# Altium schematic sheet 03_USBC_PD.SchDoc
size A3; SheetNumber: 4; SheetTotal: 6
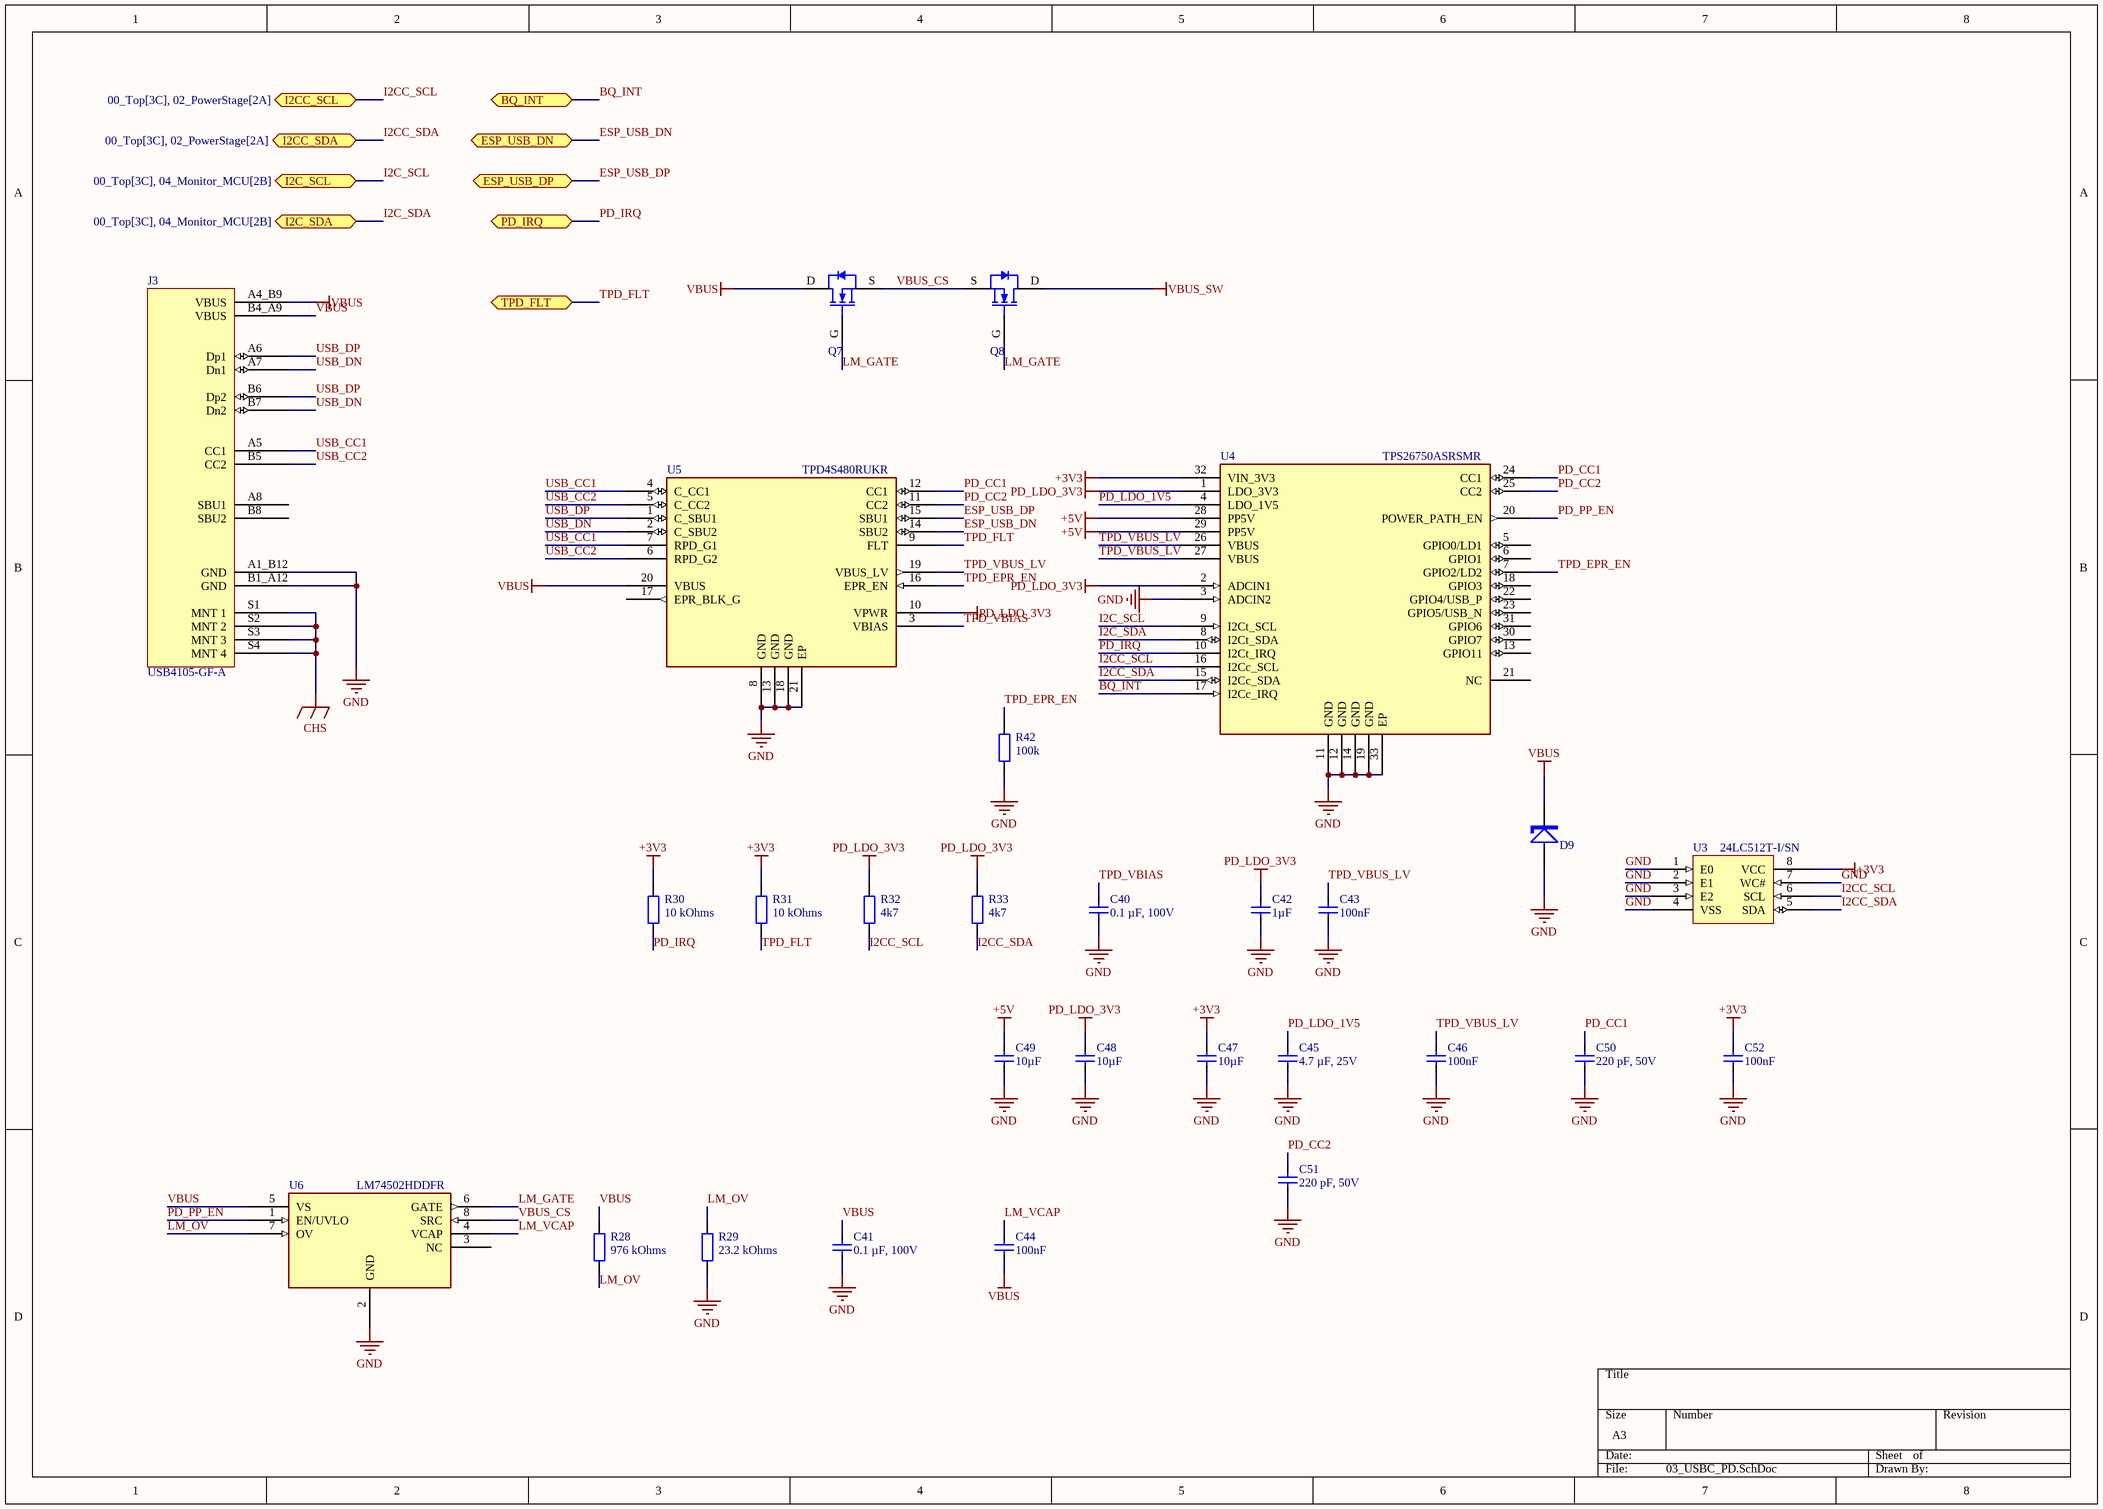
[diagram p0: 03_USBC_PD.SchDoc]

## Parts
C40  0.1 µF, 100V  [CAPC1608X10N]
C41  0.1 µF, 100V  [CAPC1608X10N]
C42  1µF  [CAPC1608X10N]
C43  100nF  [CAPC1608X10N]
C44  100nF  [CAPC1608X10N]
C45  4.7 µF, 25V  [CAPC2012X15N]
C46  100nF  [CAPC1608X10N]
C47  10µF  [CAPC2012X15N]
C48  10µF  [CAPC2012X15N]
C49  10µF  [CAPC2012X15N]
C50  220 pF, 50V  [CAPC1005X06N]
C51  220 pF, 50V  [CAPC1005X06N]
C52  100nF  [CAPC1005X06N]
D9  SMBJ54A  [SMB]  (value not drawn)
J3  USB4105-GF-A  [GCT_USB4105-GF-A]
Q7  BSZ097N10NS5ATMA1  [TRANS_PG-TSDSON-8]  (value not drawn)
Q8  BSZ097N10NS5ATMA1  [TRANS_PG-TSDSON-8]  (value not drawn)
R28  976 kOhms  [RESC1005X04N]
R29  23.2 kOhms  [RESC1005X04N]
R30  10 kOhms  [RESC1005X04N]
R31  10 kOhms  [RESC1005X04N]
R32  4k7  [RESC1005X04N]
R33  4k7  [RESC1005X04N]
R42  100k  [RESC1005X04N]
U3  24LC512T-I/SN  [SOIC127P600X175-8N]
U4  TPS26750ASRSMR  [TI-S-PVQFN-N32]
U5  TPD4S480RUKR  [QFN40P300X300X80-21N]
U6  LM74502HDDFR  [SOT65P280X100-8N]

## Ports
BQ_INT (bidir), ESP_USB_DN (bidir), ESP_USB_DP (bidir), I2C_SCL (bidir, see 00_Top[3C], 04_Monitor_MCU[2B]), I2C_SDA (bidir, see 00_Top[3C], 04_Monitor_MCU[2B]), I2CC_SCL (bidir, see 00_Top[3C], 02_PowerStage[2A]), I2CC_SDA (bidir, see 00_Top[3C], 02_PowerStage[2A]), PD_IRQ (bidir), TPD_FLT (bidir)

## Nets
+3V3: C47.2 C52.2 R30.2 R31.2 U3.8(VCC) U4.32(VIN_3V3)
+5V: C49.2 U4.28(PP5V) U4.29(PP5V)
CHS: J3.S1(MNT_1) J3.S2(MNT_2) J3.S3(MNT_3) J3.S4(MNT_4)
GND: C40.1 C41.1 C42.1 C43.1 C45.1 C46.1 C47.1 C48.1 C49.1 C50.1 C51.1 C52.1 D9.A J3.A1_B12(GND) J3.B1_A12(GND) R29.1 R42.1 U3.1(E0) U3.2(E1) U3.3(E2) U3.4(VSS) U3.7(WC#) U4.3(ADCIN2) U4.11(GND) U4.12(GND) U4.14(GND) U4.19(GND) U4.33(EP) U5.8(GND) U5.13(GND) U5.18(GND) U5.21(EP) U6.2(GND)
PD_LDO_3V3: C42.2 C48.2 R32.2 R33.2 U4.1(LDO_3V3) U4.2(ADCIN1) U5.10(VPWR)
VBUS: C41.2 C44.1 D9.K J3.A4_B9(VBUS) J3.B4_A9(VBUS) Q7.D(Drain) R28.2 U5.20(VBUS) U6.5(VS)
VBUS_SW: Q8.D(Drain)
BQ_INT: U4.17(I2Cc_IRQ) ; port BQ_INT
ESP_USB_DN: U5.14(SBU2) ; port ESP_USB_DN
ESP_USB_DP: U5.15(SBU1) ; port ESP_USB_DP
I2C_SCL: U4.9(I2Ct_SCL) ; port I2C_SCL
I2C_SDA: U4.8(I2Ct_SDA) ; port I2C_SDA
I2CC_SCL: R32.1 U3.6(SCL) U4.16(I2Cc_SCL) ; port I2CC_SCL
I2CC_SDA: R33.1 U3.5(SDA) U4.15(I2Cc_SDA) ; port I2CC_SDA
LM_GATE: Q7.G(Gate) Q8.G(Gate) U6.6(GATE)
LM_OV: R28.1 R29.2 U6.7(OV)
LM_VCAP: C44.2 U6.4(VCAP)
PD_CC1: C50.2 U4.24(CC1) U5.12(CC1)
PD_CC2: C51.2 U4.25(CC2) U5.11(CC2)
PD_IRQ: R30.1 U4.10(I2Ct_IRQ) ; port PD_IRQ
PD_LDO_1V5: C45.2 U4.4(LDO_1V5)
PD_PP_EN: U4.20(POWER_PATH_EN) U6.1(EN/UVLO)
TPD_EPR_EN: R42.2 U4.7(GPIO2/LD2) U5.16(EPR_EN)
TPD_FLT: R31.1 U5.9(FLT) ; port TPD_FLT
TPD_VBIAS: C40.2 U5.3(VBIAS)
TPD_VBUS_LV: C43.2 C46.2 U4.26(VBUS) U4.27(VBUS) U5.19(VBUS_LV)
USB_CC1: J3.A5(CC1) U5.4(C_CC1) U5.7(RPD_G1)
USB_CC2: J3.B5(CC2) U5.5(C_CC2) U5.6(RPD_G2)
USB_DN: J3.A7(Dn1) J3.B7(Dn2) U5.2(C_SBU2)
USB_DP: J3.A6(Dp1) J3.B6(Dp2) U5.1(C_SBU1)
VBUS_CS: Q7.S(Source) Q8.S(Source) U6.8(SRC)

Not connected (* = marked no-connect by the designer): J3 A8(SBU1) B8(SBU2); U4 5(GPIO0/LD1) 6(GPIO1) 13(GPIO11) 18(GPIO3) 21(NC) 22(GPIO4/USB_P) 23(GPIO5/USB_N) 30(GPIO7) 31(GPIO6); U5 17(EPR_BLK_G); U6 3(NC)

## Library data of the parts
C40 C41 = CGA3E3X7S2A104K080AB: CAP CER 0.1UF 100V X7S 0603; Manufacturer 1: TDK; AEC-Q200: True; Capacitance: 0.1 µF; Tolerance: ±10%; Case Code (Imperial): 0603; Manufacturer Part Number 1: CGA3E3X7S2A104K080AB; Mounting Type: Surface Mount, MLCC; Part Name: CGA3E3X7S2A104K080AB; Supplier 1: Digi-Key; Supplier Part Number 1: 445-6938-2-ND; Temperature Coefficient: X7S; Voltage Rating: 100V
C42 = CGA3E1X7R1C105M080AC: CAP CER 1UF 16V X7R 0603; Manufacturer 1: TDK Corporation; AEC-Q200: True; Tolerance: ±20%; Capacitance: 1 µF; Case Code (Imperial): 0603; Manufacturer Part Number 1: CGA3E1X7R1C105M080AC; Mounting Type: 0.063" L x 0.031" W (1.60mm x 0.80mm); Part Name: CGA3E1X7R1C105M080AC; Supplier 1: Digi-Key; Supplier Part Number 1: 445-12540-1-ND; Temperature Coefficient: X7R; Voltage Rating: 16V
C43 C44 C46 = CGA3E2X7R1H104M080AA: CAP CER 0.1UF 50V X7R 0603; Manufacturer 1: TDK Corporation; AEC-Q200: True; Capacitance: 0.1 µF; Tolerance: ±20%; Case Code (Imperial): 0603; Manufacturer Part Number 1: CGA3E2X7R1H104M080AA; Mounting Type: 0.063" L x 0.031" W (1.60mm x 0.80mm); Part Name: CGA3E2X7R1H104M080AA; Supplier 1: Digi-Key; Supplier Part Number 1: 445-12561-1-ND; Temperature Coefficient: X7R; Voltage Rating: 50V
C45 = CGA4J1X7R1E475K125AC: CAP CER 4.7UF 25V X7R 0805; Manufacturer 1: TDK; AEC-Q200: True; Capacitance: 4.7 µF; Tolerance: ±10%; Case Code (Imperial): 0805; Manufacturer Part Number 1: CGA4J1X7R1E475K125AC; Mounting Type: Surface Mount, MLCC; Part Name: CGA4J1X7R1E475K125AC; Supplier 1: Digi-Key; Supplier Part Number 1: 445-6967-2-ND; Temperature Coefficient: X7R; Voltage Rating: 25V
C47-C49 = CGA4J1X7S1C106K125AC: CAP CER 10UF 16V X7S 0805; Manufacturer 1: TDK Corporation; AEC-Q200: True; Tolerance: ±10%; Capacitance: 10 µF; Case Code (Imperial): 0805; Manufacturer Part Number 1: CGA4J1X7S1C106K125AC; Mounting Type: Surface Mount, MLCC; Part Name: CGA4J1X7S1C106K125AC; Supplier 1: Digi-Key; Supplier Part Number 1: 445-16110-1-ND; Temperature Coefficient: X7S; Voltage Rating: 16V
C50 C51 = CGA2B2C0G1H221J050BA: CAP CER 220PF 50V C0G/NP0 0402; Manufacturer 1: TDK Corporation; AEC-Q200: True; Temperature Coefficient: C0G, NP0; Tolerance: ±5%; Capacitance: 220 pF; Case Code (Imperial): 0402; Manufacturer Part Number 1: CGA2B2C0G1H221J050BA; Mounting Type: Surface Mount, MLCC; Part Name: CGA2B2C0G1H221J050BA; Supplier 1: Digi-Key; Voltage Rating: 50V
C52 = CGA2B1X7R1C104K050BC: CAP CER 0.1UF 16V X7R 0402; Manufacturer 1: TDK Corporation; AEC-Q200: True; Capacitance: 0.1 µF; Tolerance: ±10%; Case Code (Imperial): 0402; Manufacturer Part Number 1: CGA2B1X7R1C104K050BC; Mounting Type: Surface Mount, MLCC; Part Name: CGA2B1X7R1C104K050BC; Supplier 1: Digi-Key; Supplier Part Number 1: 445-5613-1-ND; Temperature Coefficient: X7R; Voltage Rating: 16V
D9 = SMBJ54A: TVS DIODE 54VWM 87.1VC DO214AA; Manufacturer 1: Littelfuse Inc.; Diode Type: Zener; Current Average: 6.9A; Voltage Reverse: 60V; AEC-Q200: False; Part Name: SMBJ54A; Supplier 1: Digi-Key; Supplier Part Number 1: SMBJ54ALFTR-ND; Manufacturer Part Number 1: SMBJ54A; Voltage Forward: -; Package / Case: DO-214AA, SMB; Supplier Device Package: DO-214AA (SMBJ)
J3 = USB4105-GF-A: CONN RCP USB2.0 TYP C 24P SMD RA; Manufacturer 1: GCT; Value: *; Availability: Unavailable; Price: None; Package: None; MP: USB4105-GF-A; Part Name: USB4105-GF-A; Supplier 1: Digi-Key; Supplier Part Number 1: 2073-USB4105-GF-ACT-ND; Manufacturer Part Number 1: USB4105-GF-A
Q7 Q8 = BSZ097N10NS5ATMA1: MOSFET N-CH 100V 8A/40A TSDSON; Manufacturer 1: Infineon Technologies; FET Type: N-Channel; Power Dissipation (Max): 2.1W (Ta), 69W (Tc); AEC-Q200: False; Part Name: BSZ097N10NS5ATMA1; Supplier 1: Digi-Key; Supplier Part Number 1: BSZ097N10NS5ATMA1TR-ND; Manufacturer Part Number 1: BSZ097N10NS5ATMA1; Package / Case: 8-PowerTDFN; Technology: MOSFET (Metal Oxide); Drain to Source Voltage (Vdss): 100 V; Supplier Device Package: PG-TSDSON-8-FL
R28 = ERJ-2RKF9763X: RES SMD 976K OHM 1% 1/10W 0402; Manufacturer 1: Panasonic Industry; Power (Watts): 0.1W, 1/10W; AEC-Q200: False; Part Name: ERJ-2RKF9763X; Supplier 1: Digi-Key; Supplier Part Number 1: P976KLTR-ND; Manufacturer Part Number 1: ERJ-2RKF9763X; Case Code (Imperial): 0402; Resistance: 976 kOhms; Tolerance: ±1%
R29 = ERJ-2RKF2322X: RES SMD 23.2K OHM 1% 1/10W 0402; Manufacturer 1: Panasonic Industry; Power (Watts): 0.1W, 1/10W; AEC-Q200: False; Part Name: ERJ-2RKF2322X; Supplier 1: Digi-Key; Supplier Part Number 1: P23.2KLTR-ND; Manufacturer Part Number 1: ERJ-2RKF2322X; Case Code (Imperial): 0402; Resistance: 23.2 kOhms; Tolerance: ±1%
R30 R31 = ERJ-2RKF1002X: RES SMD 10K OHM 1% 1/10W 0402; Manufacturer 1: Panasonic Industry; Power (Watts): 0.1W, 1/10W; AEC-Q200: False; Part Name: ERJ-2RKF1002X; Supplier 1: Digi-Key; Supplier Part Number 1: P10.0KLTR-ND; Manufacturer Part Number 1: ERJ-2RKF1002X; Case Code (Imperial): 0402; Resistance: 10 kOhms; Tolerance: ±1%
R32 R33 = ERJ-2RKF4701X: RES SMD 4.7K OHM 1% 1/10W 0402; Manufacturer 1: Panasonic Electronic Components; Resistance: 4.7 kOhms; Power (Watts): 0.1W, 1/10W; AEC-Q200: True; Part Name: ERJ-2RKF4701X; Supplier 1: Digi-Key; Supplier Part Number 1: P4.70KLCT-ND; Manufacturer Part Number 1: ERJ-2RKF4701X; Case Code (Imperial): 0402; Tolerance: ±1%
R42 = ERJ-2RKF1003X: RES SMD 100K OHM 1% 1/10W 0402; Manufacturer 1: Panasonic Electronic Components; AEC-Q200: True; Power (Watts): 0.1W, 1/10W; Resistance: 100 kOhms; Case Code (Imperial): 0402; Manufacturer Part Number 1: ERJ-2RKF1003X; Part Name: ERJ-2RKF1003X; Supplier 1: Digi-Key; Supplier Part Number 1: P100KLCT-ND; Tolerance: ±1%
U3 = 24LC512T-I/SN: IC EEPROM 512KBIT I2C 8SOIC; Manufacturer 1: Microchip Technology; AEC-Q200: False; Part Name: 24LC512T-I/SN; Supplier 1: Digi-Key; Supplier Part Number 1: 24LC512T-I/SNTR-ND; Manufacturer Part Number 1: 24LC512T-I/SN; Function: -; Package / Case: 8-SOIC (0.154", 3.90mm Width); Supplier Device Package: 8-SOIC
U4 = TPS26750ASRSMR: CNTRLR/SW USB-C/PD3.2 32VQFN; Manufacturer 1: Texas Instruments; Function: USB, Type-C Controller; AEC-Q200: False; Part Name: TPS26750ASRSMR; Supplier 1: Digi-Key; Supplier Part Number 1: 296-TPS26750ASRSMRTR-ND; Manufacturer Part Number 1: TPS26750ASRSMR; Package / Case: 32-VFQFN Exposed Pad; Supplier Device Package: 32-VQFN (4x4)
U5 = TPD4S480RUKR: USB TYPE-C 48V EPR PORT PROTECTO; Manufacturer 1: Texas Instruments; Function: USB Type C; AEC-Q200: False; Part Name: TPD4S480RUKR; Supplier 1: Digi-Key; Supplier Part Number 1: 296-TPD4S480RUKRTR-ND; Manufacturer Part Number 1: TPD4S480RUKR; Package / Case: 20-WFQFN Exposed Pad; Supplier Device Package: 20-WQFN (3x3)
U6 = LM74502HDDFR: 3.2-V TO 65-V INDUSTRIAL RPP CON; Manufacturer 1: Texas Instruments; Function: Reverse polarity / OV protection controller; AEC-Q200: False; Part Name: LM74502HDDFR; Supplier 1: Digi-Key; Supplier Part Number 1: 296-LM74502HDDFRTR-ND; Manufacturer Part Number 1: LM74502HDDFR; Package / Case: SOT-23-8 Thin, TSOT-23-8; Supplier Device Package: TSOT-23-8